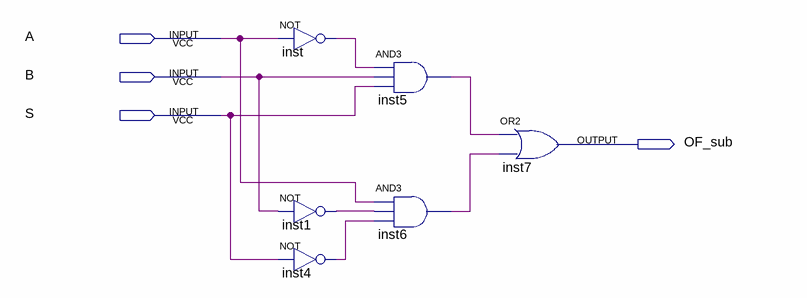
[diagram p0: schematic sheet]
// Quartus schematic OF_sub.bdf as structural Verilog: 6 symbols, 4 pins
module OF_sub (
  input  A,
  input  B,
  input  S,
  output OF_sub
);

  wire inst1_out, inst4_out, inst5_out, inst6_out, inst_out;

  not inst (inst_out, A);
  not inst1 (inst1_out, B);
  not inst4 (inst4_out, S);
  and inst5 (inst5_out, inst_out, B, S);
  and inst6 (inst6_out, A, inst1_out, inst4_out);
  or inst7 (OF_sub, inst5_out, inst6_out);
endmodule
